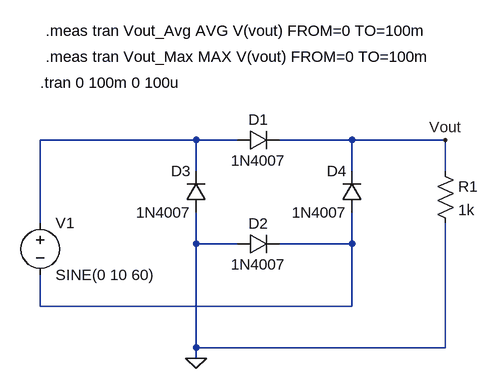
[diagram p0: schematic W02_D04_Full_Wave_Bridge_Rectifier.asc]
W02_D04_Full_Wave_Bridge_Rectifier.asc, the LTspice schematic file:
Version 4.1
SHEET 1 880 680
WIRE 256 32 16 32
WIRE 320 32 256 32
WIRE 496 32 384 32
WIRE 640 32 496 32
WIRE 256 80 256 32
WIRE 496 80 496 32
WIRE 640 80 640 32
WIRE 16 160 16 32
WIRE 256 192 256 144
WIRE 320 192 256 192
WIRE 496 192 496 144
WIRE 496 192 384 192
WIRE 16 288 16 240
WIRE 496 288 496 192
WIRE 496 288 16 288
WIRE 256 352 256 192
WIRE 640 352 640 160
WIRE 640 352 256 352
WIRE 256 368 256 352
FLAG 640 32 Vout
FLAG 256 368 0
SYMBOL voltage 16 144 R0
SYMATTR InstName V1
SYMATTR Value SINE(0 10 60)
SYMBOL diode 320 48 R270
WINDOW 0 32 32 VTop 2
WINDOW 3 0 32 VBottom 2
SYMATTR InstName D1
SYMATTR Value 1N4007
SYMBOL diode 320 208 R270
WINDOW 0 32 32 VTop 2
WINDOW 3 0 32 VBottom 2
SYMATTR InstName D2
SYMATTR Value 1N4007
SYMBOL diode 272 144 R180
WINDOW 0 24 64 Left 2
WINDOW 3 24 0 Left 2
SYMATTR InstName D3
SYMATTR Value 1N4007
SYMBOL diode 512 144 R180
WINDOW 0 24 64 Left 2
WINDOW 3 24 0 Left 2
SYMATTR InstName D4
SYMATTR Value 1N4007
SYMBOL res 624 64 R0
SYMATTR InstName R1
SYMATTR Value 1k
TEXT 16 -56 Left 2 !.tran 0 100m 0 100u
TEXT 24 -96 Left 2 !.meas tran Vout_Max MAX V(vout) FROM=0 TO=100m
TEXT 24 -136 Left 2 !.meas tran Vout_Avg AVG V(vout) FROM=0 TO=100m

The netlist it stands for:
* W02_D04_Full_Wave_Bridge_Rectifier.asc
V1 N001 N002 SINE(0 10 60)
D1 N001 Vout 1N4007
D2 0 N002 1N4007
D3 0 N001 1N4007
D4 N002 Vout 1N4007
R1 Vout 0 1k
.model D D
.lib standard.dio
.tran 0 100m 0 100u
.meas tran Vout_Max MAX V(vout) FROM=0 TO=100m
.meas tran Vout_Avg AVG V(vout) FROM=0 TO=100m
.backanno
.end